# Altium schematic sheet 6b,_6c.SchDoc
size A4; SheetNumber: 7; SheetTotal: 9
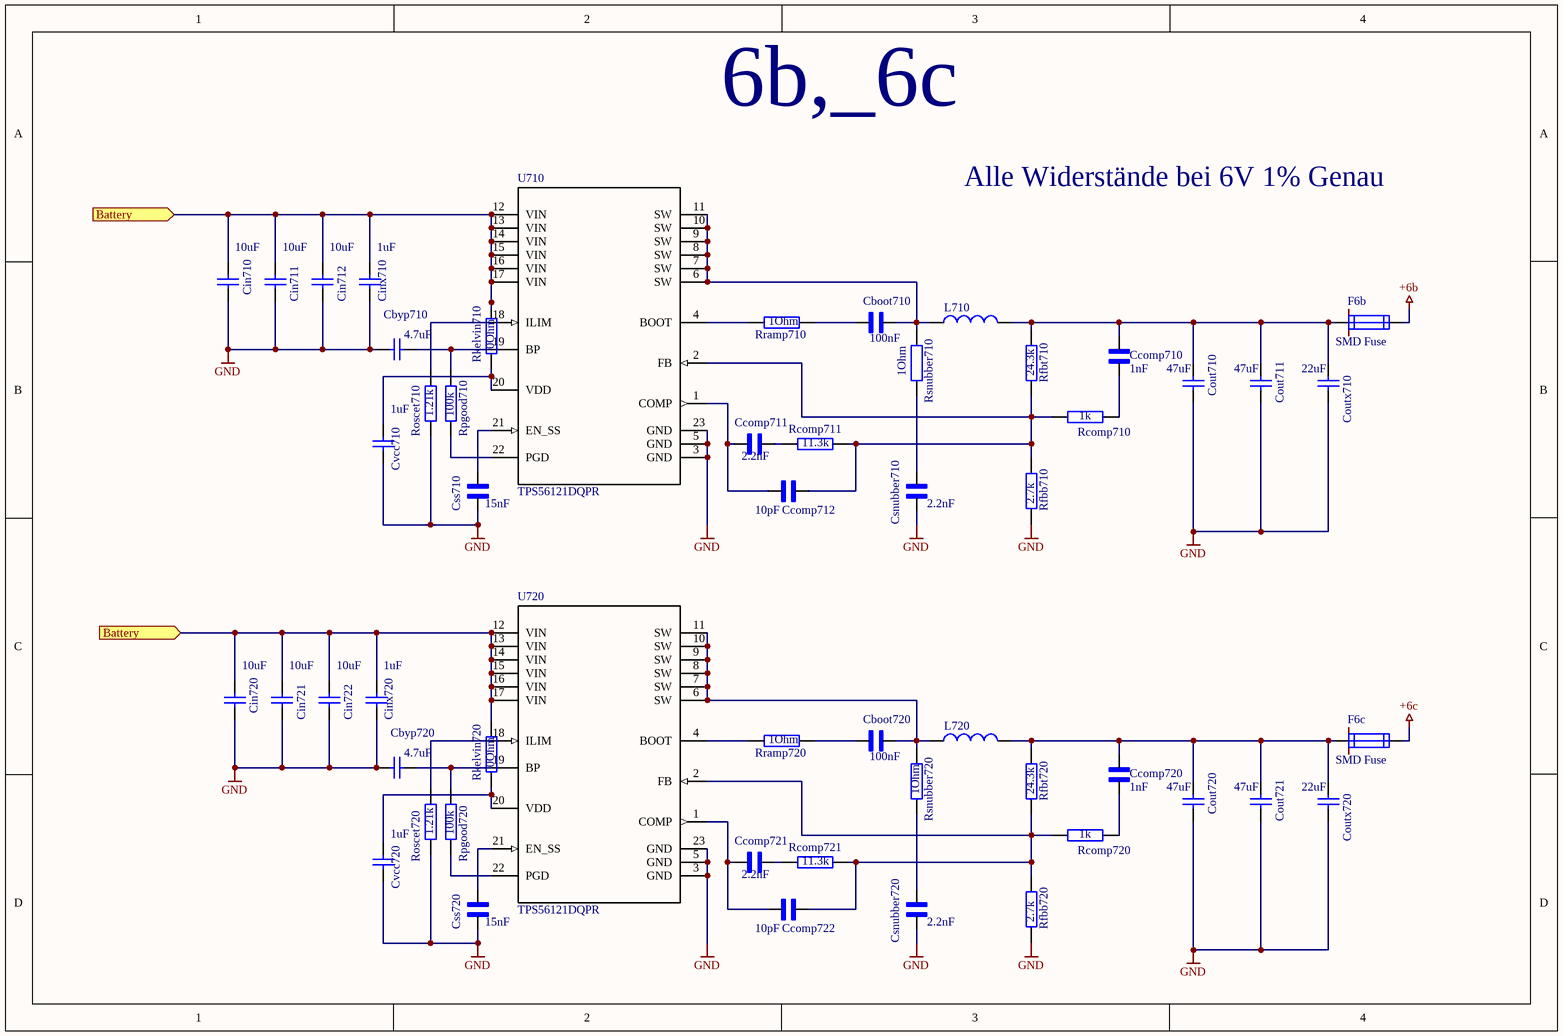
[diagram p0: 6b,_6c.SchDoc]

## Parts
Cboot710  value 100nF  [CAPC1005X61N]  (hidden comment: 1% 0402)
Cboot720  value 100nF  [CAPC1005X61N]  (hidden comment: 1% 0402)
Cbyp710  value 4.7uF  [0603]  (hidden comment: 1% 0603)
Cbyp720  value 4.7uF  [0603]  (hidden comment: 1% 0603)
Ccomp710  value 1nF  [CAPC1005X61N]  (hidden comment: 1% 0402)
Ccomp711  value 2.2nF  [CAPC1005X61N]  (hidden comment: 1% 0402)
Ccomp712  value 10pF  [CAPC1005X61N]  (hidden comment: 1% 0402)
Ccomp720  value 1nF  [CAPC1005X61N]  (hidden comment: 1% 0402)
Ccomp721  value 2.2nF  [CAPC1005X61N]  (hidden comment: 1% 0402)
Ccomp722  value 10pF  [CAPC1005X61N]  (hidden comment: 1% 0402)
Cin710  value 10uF  [0603]  (hidden comment: 1% 0603)
Cin711  value 10uF  [0603]  (hidden comment: 1% 0603)
Cin712  value 10uF  [0603]  (hidden comment: 1% 0603)
Cin720  value 10uF  [0603]  (hidden comment: 1% 0603)
Cin721  value 10uF  [0603]  (hidden comment: 1% 0603)
Cin722  value 10uF  [0603]  (hidden comment: 1% 0603)
Cinx710  value 1uF  [0603]  (hidden comment: 1% 0603)
Cinx720  value 1uF  [0603]  (hidden comment: 1% 0603)
Cout710  value 47uF  [0603]  (hidden comment: 1% 0603)
Cout711  value 47uF  [0603]  (hidden comment: 1% 0603)
Cout720  value 47uF  [0603]  (hidden comment: 1% 0603)
Cout721  value 47uF  [0603]  (hidden comment: 1% 0603)
Coutx710  value 22uF  [0603]  (hidden comment: 1% 0603)
Coutx720  value 22uF  [0603]  (hidden comment: 1% 0603)
Csnubber710  value 2.2nF  [CAPC1005X61N]  (hidden comment: 1% 0402)
Csnubber720  value 2.2nF  [CAPC1005X61N]  (hidden comment: 1% 0402)
Css710  value 15nF  [CAPC1005X61N]  (hidden comment: 1% 0402)
Css720  value 15nF  [CAPC1005X61N]  (hidden comment: 1% 0402)
Cvcc710  value 1uF  [0603]  (hidden comment: 1% 0603)
Cvcc720  value 1uF  [0603]  (hidden comment: 1% 0603)
F6b  SMD Fuse  [1206]
F6c  SMD Fuse  [1206]
L710  (no value)  [WE-HCC_807021]
L720  (no value)  [WE-HCC_807021]
Rcomp710  value 1k  [0603]  (hidden comment: 1% 0603)
Rcomp711  value 11.3k  [0603]  (hidden comment: 1% 0603)
Rcomp720  value 1k  [0603]  (hidden comment: 1% 0603)
Rcomp721  value 11.3k  [0603]  (hidden comment: 1% 0603)
Rfbb710  value 2.7k  [0603]  (hidden comment: 1% 0603)
Rfbb720  value 2.7k  [0603]  (hidden comment: 1% 0603)
Rfbt710  value 24.3k  [0603]  (hidden comment: 1% 0603)
Rfbt720  value 24.3k  [0603]  (hidden comment: 1% 0603)
Rkelvin710  value 0Ohm  [0603]  (hidden comment: 1% 0603)
Rkelvin720  value 0Ohm  [0603]  (hidden comment: 1% 0603)
Roscet710  value 1.21k  [0603]  (hidden comment: 1% 0603)
Roscet720  value 1.21k  [0603]  (hidden comment: 1% 0603)
Rpgood710  value 100k  [0603]  (hidden comment: 1% 0603)
Rpgood720  value 100k  [0603]  (hidden comment: 1% 0603)
Rramp710  value 1Ohm  [0603]  (hidden comment: 1% 0603)
Rramp720  value 1Ohm  [0603]  (hidden comment: 1% 0603)
Rsnubber710  value 1Ohm  [0603]  (hidden comment: 1% 0603)
Rsnubber720  value 1Ohm  [0603]  (hidden comment: 1% 0603)
U710  TPS56121DQPR  [DQP0022A]
U720  TPS56121DQPR  [DQP0022A]

## Ports
Battery (in, see 5V,_3V3,_6a,_Batt[1A], 5V,_3V3,_6a,_Batt[1B], 5V,_3V3,_6a,_Batt[2D], 6b,_6c[1A], Test_Sensor_Connectoren[2C]), Battery (in, see 5V,_3V3,_6a,_Batt[1A], 5V,_3V3,_6a,_Batt[1B], 5V,_3V3,_6a,_Batt[2D], 6b,_6c[1C], Test_Sensor_Connectoren[2C])

## Nets
+6b: F6b.2
+6c: F6c.2
GND: Cbyp710.2 Cbyp720.2 Cin710.2 Cin711.2 Cin712.2 Cin720.2 Cin721.2 Cin722.2 Cinx710.2 Cinx720.2 Cout710.2 Cout711.2 Cout720.2 Cout721.2 Coutx710.2 Coutx720.2 Csnubber710.1 Csnubber720.1 Css710.1 Css720.1 Cvcc710.2 Cvcc720.2 Rfbb710.1 Rfbb720.1 Roscet710.2 Roscet720.2 U710.3(GND) U710.5(GND) U710.23(GND) U720.3(GND) U720.5(GND) U720.23(GND)
Battery: Cin710.1 Cin711.1 Cin712.1 Cin720.1 Cin721.1 Cin722.1 Cinx710.1 Cinx720.1 Rkelvin710.2 Rkelvin720.2 U710.12(VIN) U710.13(VIN) U710.14(VIN) U710.15(VIN) U710.16(VIN) U710.17(VIN) U720.12(VIN) U720.13(VIN) U720.14(VIN) U720.15(VIN) U720.16(VIN) U720.17(VIN) ; port Battery
NetCboot710_1: Cboot710.1 L710.1 Rsnubber710.2 U710.6(SW) U710.7(SW) U710.8(SW) U710.9(SW) U710.10(SW) U710.11(SW)
NetCboot710_2: Cboot710.2 Rramp710.2
NetCboot720_1: Cboot720.1 L720.1 Rsnubber720.2 U720.6(SW) U720.7(SW) U720.8(SW) U720.9(SW) U720.10(SW) U720.11(SW)
NetCboot720_2: Cboot720.2 Rramp720.2
NetCbyp710_1: Cbyp710.1 Rpgood710.1 U710.19(BP)
NetCbyp720_1: Cbyp720.1 Rpgood720.1 U720.19(BP)
NetCcomp710_1: Ccomp710.1 Rcomp710.1
NetCcomp710_2: Ccomp710.2 Cout710.1 Cout711.1 Coutx710.1 F6b.1 L710.2 Rfbt710.2
NetCcomp711_1: Ccomp711.1 Ccomp712.1 U710.1(COMP)
NetCcomp711_2: Ccomp711.2 Rcomp711.1
NetCcomp712_2: Ccomp712.2 Rcomp710.2 Rcomp711.2 Rfbb710.2 Rfbt710.1 U710.2(FB)
NetCcomp720_1: Ccomp720.1 Rcomp720.1
NetCcomp720_2: Ccomp720.2 Cout720.1 Cout721.1 Coutx720.1 F6c.1 L720.2 Rfbt720.2
NetCcomp721_1: Ccomp721.1 Ccomp722.1 U720.1(COMP)
NetCcomp721_2: Ccomp721.2 Rcomp721.1
NetCcomp722_2: Ccomp722.2 Rcomp720.2 Rcomp721.2 Rfbb720.2 Rfbt720.1 U720.2(FB)
NetCsnubber710_2: Csnubber710.2 Rsnubber710.1
NetCsnubber720_2: Csnubber720.2 Rsnubber720.1
NetCss710_2: Css710.2 U710.21(EN_SS)
NetCss720_2: Css720.2 U720.21(EN_SS)
NetCvcc710_1: Cvcc710.1 Rkelvin710.1 U710.20(VDD)
NetCvcc720_1: Cvcc720.1 Rkelvin720.1 U720.20(VDD)
NetRoscet710_1: Roscet710.1 U710.18(ILIM)
NetRoscet720_1: Roscet720.1 U720.18(ILIM)
NetRpgood710_2: Rpgood710.2 U710.22(PGD)
NetRpgood720_2: Rpgood720.2 U720.22(PGD)
NetRramp710_1: Rramp710.1 U710.4(BOOT)
NetRramp720_1: Rramp720.1 U720.4(BOOT)

## Notes on the sheet
- 6b,_6c
- Alle Widerstände bei 6V 1% Genau

## Library data of the parts
Cboot710 Cboot720 Ccomp710-Ccomp712 Ccomp720-Ccomp722 Csnubber710 Csnubber720 Css710 Css720 = VJ0402D100KXCAP: Kondensator; Package: None; Price: None; MP: VJ0402D100KXCAP; Availability: Unavailable
Cbyp710 Cbyp720 Cin710-Cin712 Cin720-Cin722 Cinx710 Cinx720 Cout710 Cout711 Cout720 Cout721 Coutx710 Coutx720 Cvcc710 Cvcc720 = KO: Kondensator
F6b F6c = SICHERUNG: SMD Fuse / Voltage rating >6V / Current 12,5A / 1206; Text Field1: Strom
L710 L720 = 7443340220: 7443340220 - Würth; Manufacturer_Name: Wurth Elektronik; Datasheet Link: https://www.we-online.com/components/products/download/3D_WE-HCC-8070_7443340xxx_3D+%28rev1%29.pdf; Height: 7.2mm; Manufacturer_Part_Number: 7443340220; Mouser Part Number: 710-7443340220; Mouser Price/Stock: https://www.mouser.co.uk/ProductDetail/Wurth-Elektronik/7443340220?qs=MVRUG6Lt7nGtb48EAN9JeA%3D%3D
Rcomp710 Rcomp711 Rcomp720 Rcomp721 Rfbb710 Rfbb720 Rfbt710 Rfbt720 Rkelvin710 Rkelvin720 Roscet710 Roscet720 Rpgood710 Rpgood720 Rramp710 Rramp720 Rsnubber710 Rsnubber720 = RES: Widerstand
U710 U720 = TPS56121DQPR: Wandler IC; Manufacturer: Texas Instruments; PartNumber: TPS56121DQPR; RefDes: RefDes; TYPE: TYPE; Manufacturer_Part_Number: TPS56121DQPR; Manufacturer_Name: Texas Instruments; Copyright: Copyright (C) 2018 Accelerated Designs. All rights reserved